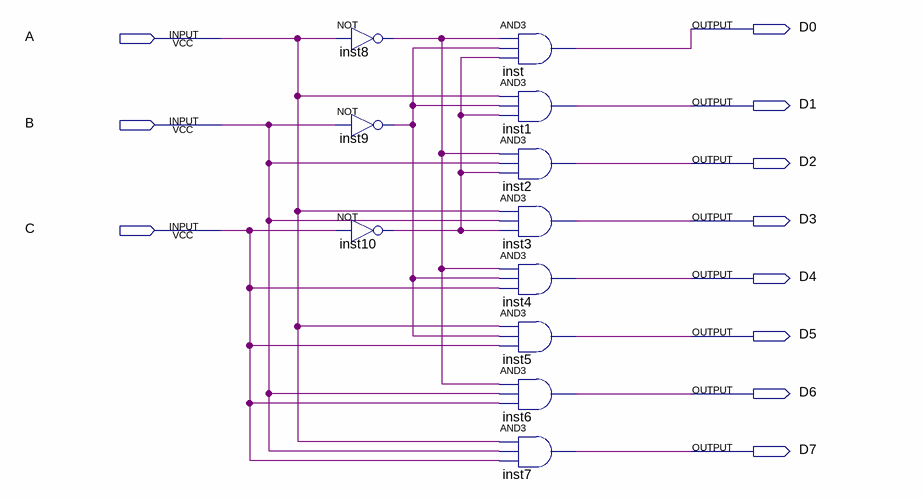
[diagram p0: schematic sheet]
// Quartus schematic exp1.bdf as structural Verilog: 11 symbols, 11 pins
module exp1 (
  input  A,
  input  B,
  input  C,
  output D0,
  output D1,
  output D2,
  output D3,
  output D4,
  output D5,
  output D6,
  output D7
);

  wire inst8_out, inst9_out, inst10_out;

  not inst8 (inst8_out, A);
  not inst9 (inst9_out, B);
  not inst10 (inst10_out, C);
  and inst (D0, inst8_out, inst9_out, inst10_out);
  and inst1 (D1, A, inst9_out, inst10_out);
  and inst2 (D2, inst8_out, B, inst10_out);
  and inst3 (D3, A, B, inst10_out);
  and inst4 (D4, inst8_out, inst9_out, C);
  and inst5 (D5, A, inst9_out, C);
  and inst6 (D6, inst8_out, B, C);
  and inst7 (D7, A, B, C);
endmodule
